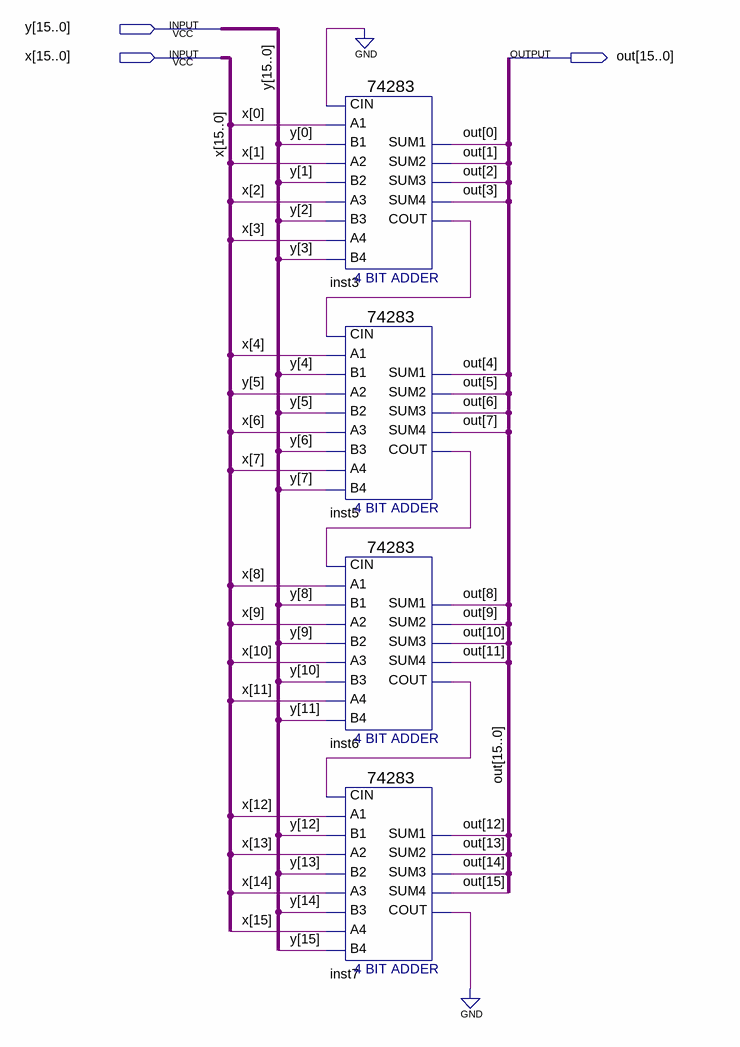
[diagram p0: schematic sheet]
// Quartus schematic adderw16.bdf as structural Verilog: 4 symbols, 3 pins
module adderw16 (
  input  [15:0] y,
  input  [15:0] x,
  output [15:0] out
);

  wire inst3_cout, inst5_cout, inst6_cout, inst7_cout;

  \74283  inst3 (
    .CIN(1'b0), .A1(x[0]), .A2(x[1]), .B2(y[1]), .A3(x[2]), .A4(x[3]), .B4(y[3]), .B1(y[0]), .B3(y[2]),
    .SUM4(out[3]), .COUT(inst3_cout), .SUM1(out[0]), .SUM2(out[1]), .SUM3(out[2]));
  \74283  inst5 (
    .CIN(inst3_cout), .A1(x[4]), .A2(y[5]), .B2(y[5]), .A3(x[6]), .A4(x[7]), .B4(y[7]), .B1(y[4]), .B3(y[6]),
    .SUM4(out[7]), .COUT(inst5_cout), .SUM1(out[4]), .SUM2(out[5]), .SUM3(out[6]));
  \74283  inst6 (
    .CIN(inst5_cout), .A1(x[8]), .A2(x[9]), .B2(y[9]), .A3(x[10]), .A4(x[11]), .B4(y[11]), .B1(y[8]),
    .B3(y[10]), .SUM4(out[11]), .COUT(inst6_cout), .SUM1(out[8]), .SUM2(out[9]), .SUM3(out[10]));
  \74283  inst7 (
    .CIN(inst6_cout), .A1(x[12]), .A2(x[13]), .B2(y[13]), .A3(x[14]), .A4(x[15]), .B4(y[15]), .B1(y[12]),
    .B3(y[14]), .SUM4(out[15]), .COUT(inst7_cout), .SUM1(out[12]), .SUM2(out[13]), .SUM3(out[14]));
  // also tied to GND on the sheet: inst7_cout
endmodule
